# Altium project SISPS-BATT-INT-PCB.PrjPcb (part 2 of 2)

## Sheet EL.SchDoc: Electronic Load
size A4; ApprovedBy: LD Stanton; Author: LD Stanton; CompanyName: University of Cape Town; DrawnBy: Lawrence Stanton; Engineer: Lawrence Stanton; Organization: University of Cape Town; Address1: Department of Electrical Engineering; Address2: Rondebosch; Address3: Cape Town; Address4: South Africa 7701; DocumentNumber: 13; SheetNumber: 13; SheetTotal: 14
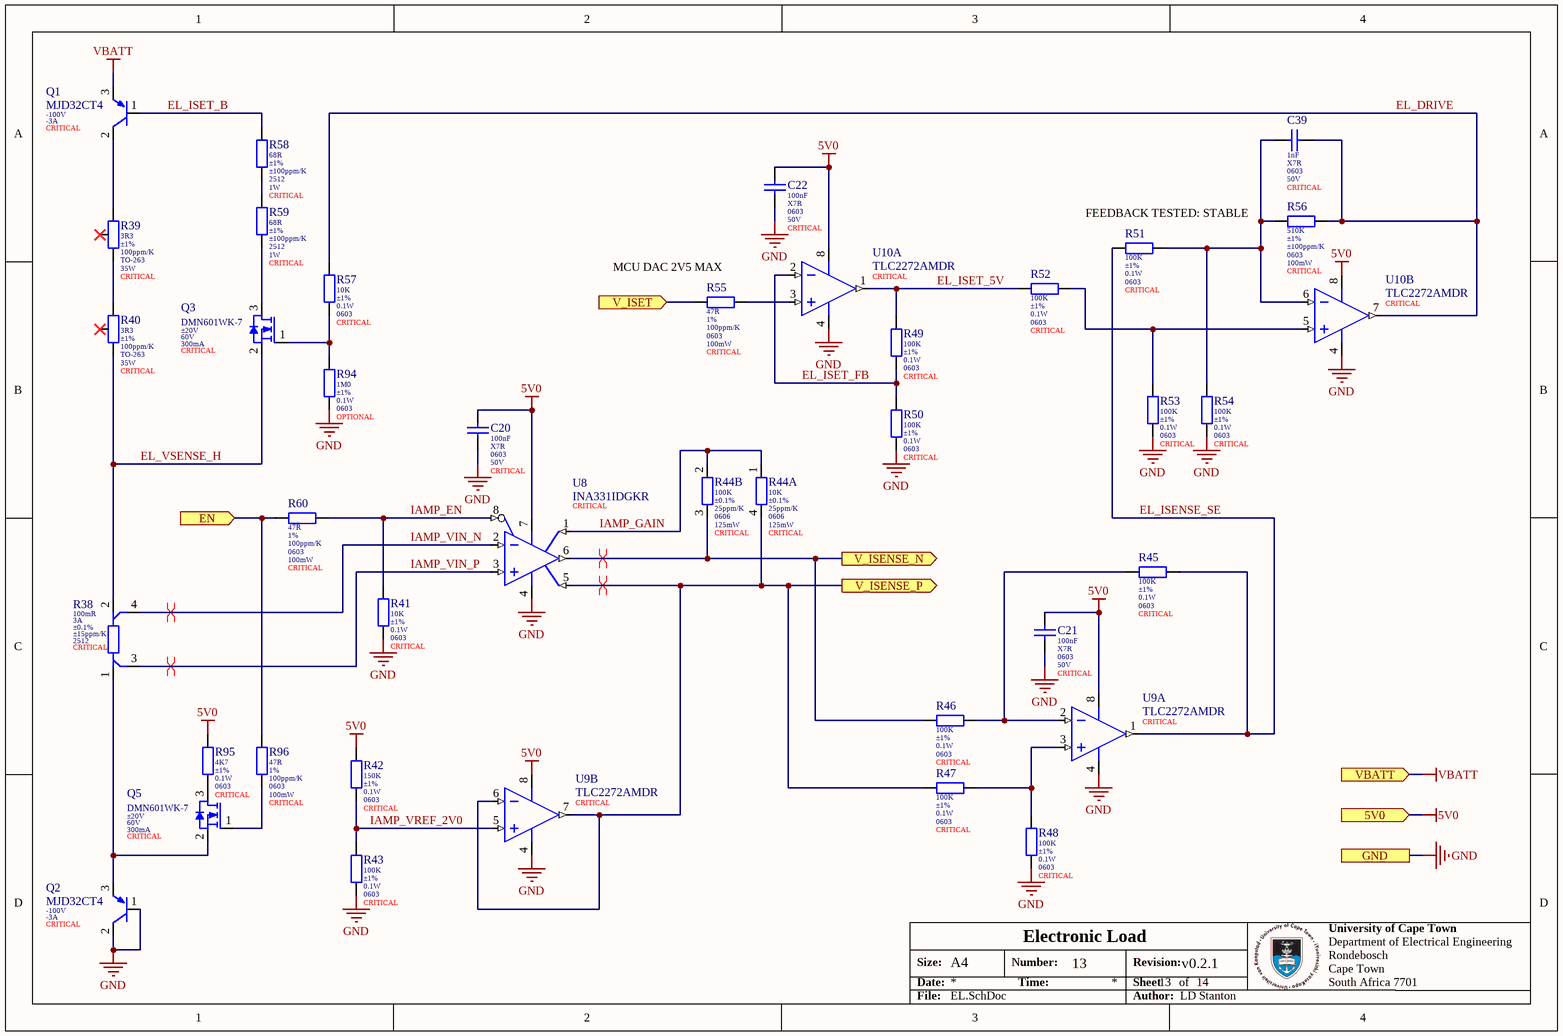
[diagram p8: EL.SchDoc]

### Parts
C20  value 100nF  Dielectric: X7R  Package: 0603  Voltage: 50V  Populate: CRITICAL  [0603 (Yageo DA) B]  (hidden comment: CC0603KRX7R9BB104)
C21  value 100nF  Dielectric: X7R  Package: 0603  Voltage: 50V  Populate: CRITICAL  [0603 (Yageo DA) B]  (hidden comment: CC0603KRX7R9BB104)
C22  value 100nF  Dielectric: X7R  Package: 0603  Voltage: 50V  Populate: CRITICAL  [0603 (Yageo DA) B]  (hidden comment: CC0603KRX7R9BB104)
C39  value 1nF  Dielectric: X7R  Package: 0603  Voltage: 50V  Populate: CRITICAL  [0603_080_8 (Samsung) B]  (hidden comment: CL10B102KB8NNNC)
Q1  MJD32CT4  Collector-Emitter Voltage: -100V  Collector Current: -3A  Placement: CRITICAL  [TO-252 (MJD32C) B]
Q2  MJD32CT4  Collector-Emitter Voltage: -100V  Collector Current: -3A  Placement: CRITICAL  [TO-252 (MJD32C) B]
Q3  DMN601WK-7  Gate Source Voltage: ±20V  Drain Source Voltage: 60V  Continous Drain Current: 300mA  Placement: CRITICAL  [SOT323 (DMN601WK) B]
Q5  DMN601WK-7  Gate Source Voltage: ±20V  Drain Source Voltage: 60V  Continous Drain Current: 300mA  Placement: CRITICAL  [SOT323 (DMN601WK) B]
R38  value 100mR  Current Rating: 3A  Tolerance: ±0.1%  Temperature Coefficient: ±15ppm/K  Package: 2512  Populate: CRITICAL  [2512 (Resi PCSR2512) MRG]  (hidden comment: PCSR2512BR100M6)
R39  value 3R3  Tolerance: ±1%  Temperature Coefficient: 100ppm/K  Package: TO-263  Power: 35W  Populate: CRITICAL  [TO-263 (TPAL0263) B]  (hidden comment: TPAL0263F3R30K9)
R40  value 3R3  Tolerance: ±1%  Temperature Coefficient: 100ppm/K  Package: TO-263  Power: 35W  Populate: CRITICAL  [TO-263 (TPAL0263) B]  (hidden comment: TPAL0263F3R30K9)
R41  value 10K  Tolerance: ±1%  Power: 0.1W  Package: 0603  Populate: CRITICAL  [0603 (Uniroyal) B]  (hidden comment: 0603WAF1002T5E)
R42  value 150K  Tolerance: ±1%  Power: 0.1W  Package: 0603  Populate: CRITICAL  [0603 (Uniroyal) B]  (hidden comment: 0603WAF1503T5E)
R43  value 100K  Tolerance: ±1%  Power: 0.1W  Package: 0603  Populate: CRITICAL  [0603 (Uniroyal) B]  (hidden comment: 0603WAF1003T5E)
R44  value 10K  Tolerance: ±0.1%  Temperature Coefficient: 25ppm/K  Package: 0606  Power: 125mW  Populate: CRITICAL  [0606 (Vishay ACASN) B]  (hidden comment: ACASN1002S1003P1AT)  (parts A,B of 2)
R45  value 100K  Tolerance: ±1%  Power: 0.1W  Package: 0603  Populate: CRITICAL  [0603 (Uniroyal) B]  (hidden comment: 0603WAF1003T5E)
R46  value 100K  Tolerance: ±1%  Power: 0.1W  Package: 0603  Populate: CRITICAL  [0603 (Uniroyal) B]  (hidden comment: 0603WAF1003T5E)
R47  value 100K  Tolerance: ±1%  Power: 0.1W  Package: 0603  Populate: CRITICAL  [0603 (Uniroyal) B]  (hidden comment: 0603WAF1003T5E)
R48  value 100K  Tolerance: ±1%  Power: 0.1W  Package: 0603  Populate: CRITICAL  [0603 (Uniroyal) B]  (hidden comment: 0603WAF1003T5E)
R49  value 100K  Tolerance: ±1%  Power: 0.1W  Package: 0603  Populate: CRITICAL  [0603 (Uniroyal) B]  (hidden comment: 0603WAF1003T5E)
R50  value 100K  Tolerance: ±1%  Power: 0.1W  Package: 0603  Populate: CRITICAL  [0603 (Uniroyal) B]  (hidden comment: 0603WAF1003T5E)
R51  value 100K  Tolerance: ±1%  Power: 0.1W  Package: 0603  Populate: CRITICAL  [0603 (Uniroyal) B]  (hidden comment: 0603WAF1003T5E)
R52  value 100K  Tolerance: ±1%  Power: 0.1W  Package: 0603  Populate: CRITICAL  [0603 (Uniroyal) B]  (hidden comment: 0603WAF1003T5E)
R53  value 100K  Tolerance: ±1%  Power: 0.1W  Package: 0603  Populate: CRITICAL  [0603 (Uniroyal) B]  (hidden comment: 0603WAF1003T5E)
R54  value 100K  Tolerance: ±1%  Power: 0.1W  Package: 0603  Populate: CRITICAL  [0603 (Uniroyal) B]  (hidden comment: 0603WAF1003T5E)
R55  value 47R  Tolerance: 1%  Temperature Coefficient: 100ppm/K  Package: 0603  Power: 100mW  Populate: CRITICAL  [0603 (Uniroyal) B]  (hidden comment: 0603WAF470JT5E)
R56  value 510K  Tolerance: ±1%  Temperature Coefficient: ±100ppm/K  Package: 0603  Power: 100mW  Populate: CRITICAL  [0603 (Uniroyal) B]  (hidden comment: 0603WAF5103T5E)
R57  value 10K  Tolerance: ±1%  Power: 0.1W  Package: 0603  Populate: CRITICAL  [0603 (Uniroyal) B]  (hidden comment: 0603WAF1002T5E)
R58  value 68R  Tolerance: ±1%  Temperature Coefficient: ±100ppm/K  Package: 2512  Power: 1W  Populate: CRITICAL  [2512 (Uniroyal) B]  (hidden comment: 25121WF680JT4E)
R59  value 68R  Tolerance: ±1%  Temperature Coefficient: ±100ppm/K  Package: 2512  Power: 1W  Populate: CRITICAL  [2512 (Uniroyal) B]  (hidden comment: 25121WF680JT4E)
R60  value 47R  Tolerance: 1%  Temperature Coefficient: 100ppm/K  Package: 0603  Power: 100mW  Populate: CRITICAL  [0603 (Uniroyal) B]  (hidden comment: 0603WAF470JT5E)
R94  value 1M0  Tolerance: ±1%  Power: 0.1W  Package: 0603  Populate: OPTIONAL  [0603 (Uniroyal) B]  (hidden comment: 0603WAF1004T5E)
R95  value 4K7  Tolerance: ±1%  Power: 0.1W  Package: 0603  Populate: CRITICAL  [0603 (Uniroyal) B]  (hidden comment: 0603WAF4701T5E)
R96  value 47R  Tolerance: 1%  Temperature Coefficient: 100ppm/K  Package: 0603  Power: 100mW  Populate: CRITICAL  [0603 (Uniroyal) B]  (hidden comment: 0603WAF470JT5E)
U8  INA331IDGKR  Placement: CRITICAL  [MSOP-8 (INA331) B]
U9  TLC2272AMDR  Placement: CRITICAL  [SOIC-8 (D008A) B]  (parts A,B of 2)
U10  TLC2272AMDR  Placement: CRITICAL  [SOIC-8 (D008A) B]  (parts A,B of 2)

### Ports
5V0 (in), EN (in), GND, V_ISENSE_N (out), V_ISENSE_P (out), V_ISET (in), VBATT (in)

### Nets
5V0: C20.1 C21.1 C22.1 R42.1 R95.1 U8.7(V+) U9.8(VDD+) U10.8(VDD+) ; port 5V0  [project net 5V0A]
GND: C20.2 C21.2 C22.2 Q2.1(B) Q2.2(C) R41.2 R43.2 R48.1 R50.1 R53.1 R54.1 R94.2 U8.4(V-) U9.4(VDD-/GND) U10.4(VDD-/GND) ; port GND
VBATT: Q1.3(E) ; port VBATT
EIS_EN: R60.1 R96.2 ; port EN
EIS_VISENSE_N: R44.3 R46.1 U8.6(VOUT) ; port V_ISENSE_N
EIS_VISENSE_P: R44.4 R47.1 U8.5(REF) U9.6(IN2-) U9.7(OUT2) ; port V_ISENSE_P
EL_DRIVE: C39.2 R56.2 R57.1 U10.7(OUT2)
EL_ISENSE_SE: R45.2 R51.2 U9.1(OUT1)
EL_ISET_5V: R49.2 R52.2 U10.1(OUT1)
EL_ISET_B: Q1.1(B) R58.1
EL_ISET_FB: R49.1 R50.2 U10.2(IN1-)
EL_VSENSE_H: Q3.2(S) R38.2 R40.1
IAMP_EN: R41.1 R60.2 U8.8(~{SHUTDOWN})
IAMP_GAIN: R44.1 R44.2 U8.1(RG)
IAMP_VIN_N: R38.4 U8.2(VIN-)
IAMP_VIN_P: R38.3 U8.3(VIN+)
IAMP_VREF_2V0: R42.2 R43.1 U9.5(IN2+)
MCU_DAC: R55.1 ; port V_ISET
NetC39_1: C39.1 R51.1 R54.2 R56.1 U10.6(IN2-)
NetQ1_2: Q1.2(C) R39.2
NetQ2_3: Q2.3(E) Q5.2(S) R38.1
NetQ3_1: Q3.1(G) R57.2 R94.1
NetQ3_3: Q3.3(D) R59.2
NetQ5_1: Q5.1(G) R96.1
NetQ5_3: Q5.3(D) R95.2
NetR39_1: R39.1 R40.2
NetR45_1: R45.1 R46.2 U9.2(IN1-)
NetR47_2: R47.2 R48.2 U9.3(IN1+)
NetR52_1: R52.1 R53.2 U10.5(IN2+)
NetR55_2: R55.2 U10.3(IN1+)
NetR58_2: R58.2 R59.1

Not connected (* = marked no-connect by the designer): R39 3*; R40 3*

### Layout directives
differential pair: EIS_VISENSE_N, EIS_VISENSE_P, IAMP_VIN_N, IAMP_VIN_P

### Notes on the sheet
- (near R51) FEEDBACK TESTED: STABLE
- (near R55) MCU DAC 2V5 MAX
- Labels drawn without touching a wire or pin: \
- Size:
- Date:
- A4
- Number:
- Time:
- Revision:
- Sheet
- of
- File:
- Author:

### Library data of the parts
C20-C22 = CMP-047-000000-9: as C40 on sheet RS485; Tolerance: ±10%; ComponentLink1Description: Datasheet; ComponentLink1URL: https://datasheet.lcsc.com/szlcsc/YAGEO-CC0603KRX7R9BB104_C14663.pdf; LCSC Part Number: C14663
C39 = CMP-045-000000-10: MLCC 1nF 0603 50V X7R ±10%; Manufacturer: Samsung; ComponentLink1URL: https://datasheet.lcsc.com/szlcsc/Samsung-Electro-Mechanics-CL05C100JB5NNNC_C32949.pdf; Tolerance: ±10%; ComponentLink1Description: Datasheet; LCSC Part Number: C1588
Q1 Q2 = CMP-00132-1: Power Bipolar Transistor, 3A I(C), 100V V(BR)CEO, 1-Element, PNP, Silicon, Plastic/Epoxy, 2 Pin; pin to pad: 2>4; Base Current: -1A; Emitter-Base Voltage: -5V; ComponentLink1Description: Datasheet; ComponentLink1URL: https://mm.digikey.com/Volume0/opasdata/d220001/medias/docus/844/MJD32C_Rev4_Jun2012.pdf; Max Operating Temperature: 160°C; LCSC Part Number: C2905365; Min Operating Temperature: -65°C; Collector-Base Voltage: -100V
Q3 Q5 = CMP-00131-1: Mosfet, N-Ch, 60V, 0.3A, Sot-323 Rohs Compliant: Yes; Drain Source Resistance: 2; Polarity: N-Channel; Mode: Enhancement; LCSC Part Number: C151318; ComponentLink1URL: https://jlcpcb.com/api/file/downloadByFileSystemAccessId/8586203582969860096; Min Operating Temperature: -65°C; ComponentLink1Description: Datasheet; Max Operating Temperature: 150°C
R38 = CMP-009-00005-3: 100mΩ 1W Current Sense Resistor ±0.1% ±15ppm/K 2512; LCSC Part Number: C23067426; ComponentLink1URL: https://s.resistor.today/shop/products/epdf/PCSR2512.pdf; Composition: Wirewound; Power: 1W; Min Operating Temperature: -55°C; Max Operating Temperature: 170°C; ComponentLink1Description: Datasheet
R39 R40 = CMP-009-00007-1: 3.3Ω 35W 500V Planar Non-Inductive Power Resistor ±1% ±100ppm/℃ TO-263; ComponentLink1URL: https://s.resistor.today/shop/products/epdf/TPAL0263.pdf; Max Operating Temperature: 150°C; Min Operating Temperature: -55°C; ComponentLink1Description: Datasheet; LCSC Part Number: C22446548; Voltage Rating: 500V
R41 R57 = CMP-010-000293-9: Resistor 10K 0603 ±1% Thick Film Uniroyal; Working Voltage: 75V; Temperature Coefficient: ±100ppm/K; Temperature: -55 - 155°C; ComponentLink1URL: https://datasheet.lcsc.com/szlcsc/1811062009_UNI-ROYAL-Uniroyal-Elec-0603WAF1002T5E_C25804.pdf; LCSC Part Number: C25804; ComponentLink1Description: Datasheet; Pin Count: 2; Manufacturer: Uniroyal
R42 = CMP-010-000303-9: Resistor 150K 0603 ±1% Thick Film Uniroyal; Temperature Coefficient: ±100ppm/K; Working Voltage: 75V; Manufacturer: Uniroyal; ComponentLink1URL: https://datasheet.lcsc.com/szlcsc/1811062009_UNI-ROYAL-Uniroyal-Elec-0603WAF1002T5E_C25804.pdf; Temperature: -55 - 155°C; LCSC Part Number: C22807; ComponentLink1Description: Datasheet; Pin Count: 2
R43 R45-R54 = CMP-010-000288-10: Resistor 100K 0603 ±1% Thick Film Uniroyal; Temperature Coefficient: ±100ppm/K; Working Voltage: 75V; LCSC Part Number: C25803; Temperature: -55 - 155°C; ComponentLink1URL: https://datasheet.lcsc.com/szlcsc/1811062009_UNI-ROYAL-Uniroyal-Elec-0603WAF1002T5E_C25804.pdf; Pin Count: 2; Manufacturer: Uniroyal; ComponentLink1Description: Datasheet
R44 = CMP-009-00004-9: Resistor Array 100K,10K 0606 ±0.1% Thin Film Vishay; Voltage Rating: 100V; Min Operating Temperature: -55°C; LCSC Part Number: C6733329; Composition: Thin Film; ComponentLink1URL: https://www.vishay.com/docs/28770/acasat.pdf; Value 1: 10K; Value 2: 100K; ComponentLink1Description: Datasheet; Max Operating Temperature: 125°C
R55 R60 R96 = CMP-00128-3: as R76 on sheet RS485; ComponentLink1Description: Datasheet; Min Operating Temperature: -55°C; Manufacturer: Uniroyal; ComponentLink1URL: https://datasheet.lcsc.com/szlcsc/1811062009_UNI-ROYAL-Uniroyal-Elec-0603WAF1002T5E_C25804.pdf; Composition: Thick Film; LCSC Part Number: C23182; Max Operating Temperature: 155°C
R56 = CMP-00137-1: Resistor 510K 0603 ±1% Thick Film Uniroyal; Voltage Rating: 75V; Min Operating Temperature: -55°C; ComponentLink1Description: Datasheet; Manufacturer: Uniroyal; LCSC Part Number: C23192; ComponentLink1URL: https://datasheet.lcsc.com/szlcsc/1811062009_UNI-ROYAL-Uniroyal-Elec-0603WAF1002T5E_C25804.pdf; Max Operating Temperature: 155°C; Composition: Thick Film
R58 R59 = CMP-00133-1: Resistor 68R 2512 ±1% 1W Thick Film Uniroyal; Voltage Rating: 200V; ComponentLink1URL: https://datasheet.lcsc.com/lcsc/1810301111_UNI-ROYAL-Uniroyal-Elec-25121WF100MT4E_C127692.pdf; ComponentLink1Description: Datasheet; Max Operating Temperature: 155°C; Temperature: -55 - 155°C; Min Operating Temperature: -55°C; Composition: Thick Film; LCSC Part Number: C50371
R94 = CMP-010-000313-12: Resistor 1M0 0603 ±1% Thick Film Uniroyal; Working Voltage: 75V; Temperature Coefficient: ±100ppm/K; Temperature: -55 - 155°C; Pin Count: 2; Manufacturer: Uniroyal; LCSC Part Number: C22935; ComponentLink1Description: Datasheet; ComponentLink1URL: https://datasheet.lcsc.com/szlcsc/1811062009_UNI-ROYAL-Uniroyal-Elec-0603WAF1002T5E_C25804.pdf
R95 = CMP-010-000405-2: Resistor 4K7 0603 ±1% Thick Film Uniroyal; Temperature Coefficient: ±100ppm/K; Working Voltage: 75V; Manufacturer: Uniroyal; ComponentLink1Description: Datasheet; Temperature: -55 - 155°C; ComponentLink1URL: https://datasheet.lcsc.com/szlcsc/1811062009_UNI-ROYAL-Uniroyal-Elec-0603WAF1002T5E_C25804.pdf; LCSC Part Number: C23162
U8 = CMP-014-00000-1: Low-Power, Single Supply, CMOS, Instrumentation Amplifier 8-VSSOP -55 to 125; Output Current: 48mA; Output Type: Push-Pull; Max Supply Voltage: 5.5V; Min Supply Voltage: 2.5V; Min Operating Temperature: -55°C; Max Operating Temperature: 125°C; ComponentLink1Description: Datasheet; ComponentLink1URL: https://www.ti.com/lit/ds/symlink/ina331.pdf?ts=1756763479272&ref_url=https%253A%252F%252Fwww.google.com%252F; LCSC Part Number: C2863664
U9 U10 = CMP-00126-1: Operational Amplifier, 2 Func, 1500uV Offset-Max, CMOS, PDSO8; Single Supply: Yes; Output Current: 50mA; Input Bias Current: 800pA; Input Offset Voltage: 1.5mV; Supply Max: 8V; Supply Min: -8V; Rail to Rail: Yes; ComponentLink1Description: Datasheet; Input Offset Current: 800pA; LCSC Part Number: C2878284; Min Operating Temperature: -55°C; Max Operating Temperature: 125°C; ComponentLink1URL: https://www.ti.com/lit/ds/symlink/tlc2272.pdf?ts=1754033641708&ref_url=https%253A%252F%252Fwww.ti.com%252Fproduct%252FTLC2272%253Futm_source%253Dgoogle%2526utm_medium%253Dcpc%2526utm_campaign%253Dasc-amps-null-44700045336317476_prodfolderdynamic-cpc-pf-go

## Sheet VBATT Sense.SchDoc: Battery Voltage Sense
size A4; ApprovedBy: LD Stanton; Author: LD Stanton; CompanyName: University of Cape Town; DrawnBy: Lawrence Stanton; Engineer: Lawrence Stanton; Organization: University of Cape Town; Address1: Department of Electrical Engineering; Address2: Rondebosch; Address3: Cape Town; Address4: South Africa 7701; DocumentNumber: 11; SheetNumber: 11; SheetTotal: 14
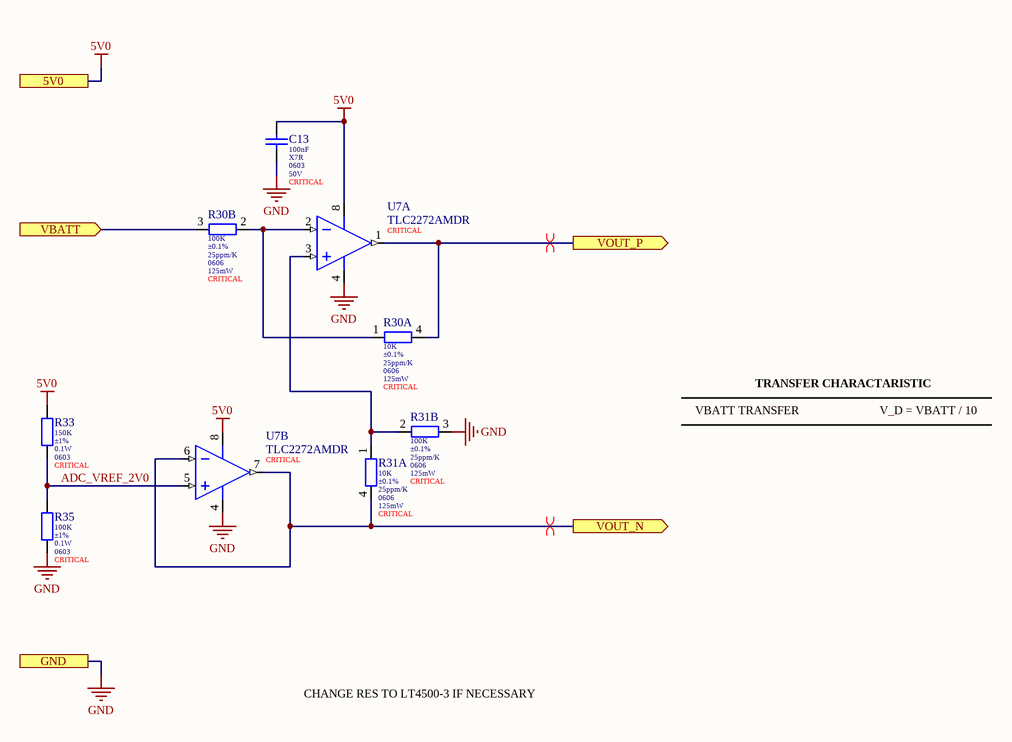
[diagram p9: VBATT Sense.SchDoc]

### Parts
C13  value 100nF  Dielectric: X7R  Package: 0603  Voltage: 50V  Populate: CRITICAL  [0603 (Yageo DA) B]  (hidden comment: CC0603KRX7R9BB104)
R30  value 10K  Tolerance: ±0.1%  Temperature Coefficient: 25ppm/K  Package: 0606  Power: 125mW  Populate: CRITICAL  [0606 (Vishay ACASN) B]  (hidden comment: ACASN1002S1003P1AT)  (parts A,B of 2)
R31  value 10K  Tolerance: ±0.1%  Temperature Coefficient: 25ppm/K  Package: 0606  Power: 125mW  Populate: CRITICAL  [0606 (Vishay ACASN) B]  (hidden comment: ACASN1002S1003P1AT)  (parts A,B of 2)
R33  value 150K  Tolerance: ±1%  Power: 0.1W  Package: 0603  Populate: CRITICAL  [0603 (Uniroyal) B]  (hidden comment: 0603WAF1503T5E)
R35  value 100K  Tolerance: ±1%  Power: 0.1W  Package: 0603  Populate: CRITICAL  [0603 (Uniroyal) B]  (hidden comment: 0603WAF1003T5E)
U7  TLC2272AMDR  Placement: CRITICAL  [SOIC-8 (D008A) B]  (parts A,B of 2)

### Ports
5V0, GND, VBATT (in), VOUT_N (out), VOUT_P (out)

### Nets
5V0: C13.1 R33.1 U7.8(VDD+) ; port 5V0  [project net 5V0A]
GND: C13.2 R31.3 R35.2 U7.4(VDD-/GND) ; port GND
VBATT: R30.3 ; port VBATT
ADC_VREF_2V0: R33.2 R35.1 U7.5(IN2+)
EIS_VBATT_N: R31.4 U7.6(IN2-) U7.7(OUT2) ; port VOUT_N
EIS_VBATT_P: R30.4 U7.1(OUT1) ; port VOUT_P
NetR30_1: R30.1 R30.2 U7.2(IN1-)
NetR31_1: R31.1 R31.2 U7.3(IN1+)

### Layout directives
differential pair: EIS_VBATT_N, EIS_VBATT_P

### Notes on the sheet
- VBATT TRANSFER
- TRANSFER CHARACTARISTIC
- V_D = VBATT / 10
- CHANGE RES TO LT4500-3 IF NECESSARY
- Size:
- Date:
- A4
- Number:
- Time:
- Revision:
- Sheet
- of
- File:
- Author:

### Library data of the parts
C13 = CMP-047-000000-9: as C40 on sheet RS485; Tolerance: ±10%; ComponentLink1Description: Datasheet; ComponentLink1URL: https://datasheet.lcsc.com/szlcsc/YAGEO-CC0603KRX7R9BB104_C14663.pdf; LCSC Part Number: C14663
R30 R31 = CMP-009-00004-9: as R44 on sheet EL; LCSC Part Number: C6733329; Value 2: 100K; Composition: Thin Film; Value 1: 10K; Min Operating Temperature: -55°C; Max Operating Temperature: 125°C; ComponentLink1URL: https://www.vishay.com/docs/28770/acasat.pdf; ComponentLink1Description: Datasheet
R33 = CMP-010-000303-9: as R42 on sheet EL; Manufacturer: Uniroyal; ComponentLink1URL: https://datasheet.lcsc.com/szlcsc/1811062009_UNI-ROYAL-Uniroyal-Elec-0603WAF1002T5E_C25804.pdf; Temperature: -55 - 155°C; LCSC Part Number: C22807; ComponentLink1Description: Datasheet; Pin Count: 2
R35 = CMP-010-000288-10: as R43 on sheet EL; LCSC Part Number: C25803; Temperature: -55 - 155°C; ComponentLink1URL: https://datasheet.lcsc.com/szlcsc/1811062009_UNI-ROYAL-Uniroyal-Elec-0603WAF1002T5E_C25804.pdf; Pin Count: 2; Manufacturer: Uniroyal; ComponentLink1Description: Datasheet
U7 = CMP-00126-1: as U9 on sheet EL; Rail to Rail: Yes; ComponentLink1Description: Datasheet; Input Offset Current: 800pA; LCSC Part Number: C2878284; Min Operating Temperature: -55°C; Max Operating Temperature: 125°C; ComponentLink1URL: https://www.ti.com/lit/ds/symlink/tlc2272.pdf?ts=1754033641708&ref_url=https%253A%252F%252Fwww.ti.com%252Fproduct%252FTLC2272%253Futm_source%253Dgoogle%2526utm_medium%253Dcpc%2526utm_campaign%253Dasc-amps-null-44700045336317476_prodfolderdynamic-cpc-pf-go

## Sheet ADC.SchDoc: Analogue to Digital Converter
size A4; ApprovedBy: LD Stanton; Author: LD Stanton; CompanyName: University of Cape Town; DrawnBy: Lawrence Stanton; Engineer: Lawrence Stanton; Organization: University of Cape Town; Address1: Department of Electrical Engineering; Address2: Rondebosch; Address3: Cape Town; Address4: South Africa 7701; DocumentNumber: 8; SheetNumber: 8; SheetTotal: 14
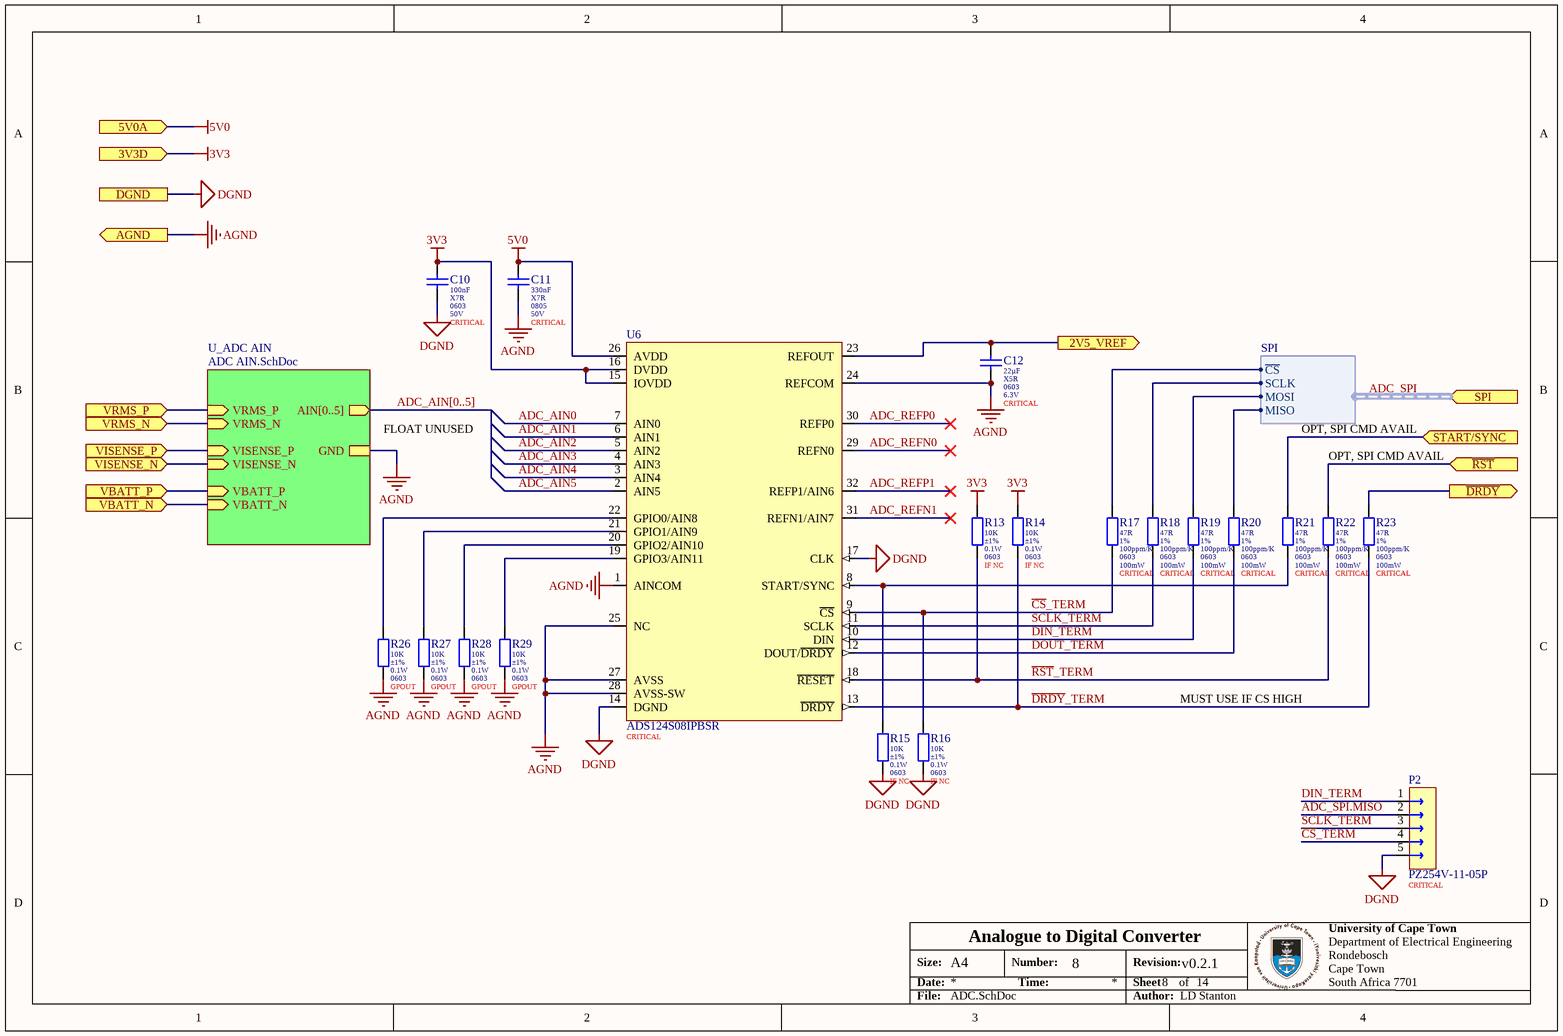
[diagram p10: ADC.SchDoc]

### Parts
C10  value 100nF  Dielectric: X7R  Package: 0603  Voltage: 50V  Populate: CRITICAL  [0603 (Yageo DA) B]  (hidden comment: CC0603KRX7R9BB104)
C11  value 330nF  Dielectric: X7R  Package: 0805  Voltage: 50V  Populate: CRITICAL  [0805_125_F (Samsumg) B]  (hidden comment: CL21B334KBFNNNE)
C12  value 22µF  Dielectric: X5R  Package: 0603  Voltage: 6.3V  Populate: CRITICAL  [0603_080_8 (Samsung) B]  (hidden comment: CL10A226MQ8NRNC)
P2  PZ254V-11-05P  Placement: CRITICAL  [Pin Header 5 1 Male Vertical]
R13  value 10K  Tolerance: ±1%  Power: 0.1W  Package: 0603  Populate: IF NC  [0603 (Uniroyal) B]  (hidden comment: 0603WAF1002T5E)
R14  value 10K  Tolerance: ±1%  Power: 0.1W  Package: 0603  Populate: IF NC  [0603 (Uniroyal) B]  (hidden comment: 0603WAF1002T5E)
R15  value 10K  Tolerance: ±1%  Power: 0.1W  Package: 0603  Populate: IF NC  [0603 (Uniroyal) B]  (hidden comment: 0603WAF1002T5E)
R16  value 10K  Tolerance: ±1%  Power: 0.1W  Package: 0603  Populate: IF NC  [0603 (Uniroyal) B]  (hidden comment: 0603WAF1002T5E)
R17  value 47R  Tolerance: 1%  Temperature Coefficient: 100ppm/K  Package: 0603  Power: 100mW  Populate: CRITICAL  [0603 (Uniroyal) B]  (hidden comment: 0603WAF470JT5E)
R18  value 47R  Tolerance: 1%  Temperature Coefficient: 100ppm/K  Package: 0603  Power: 100mW  Populate: CRITICAL  [0603 (Uniroyal) B]  (hidden comment: 0603WAF470JT5E)
R19  value 47R  Tolerance: 1%  Temperature Coefficient: 100ppm/K  Package: 0603  Power: 100mW  Populate: CRITICAL  [0603 (Uniroyal) B]  (hidden comment: 0603WAF470JT5E)
R20  value 47R  Tolerance: 1%  Temperature Coefficient: 100ppm/K  Package: 0603  Power: 100mW  Populate: CRITICAL  [0603 (Uniroyal) B]  (hidden comment: 0603WAF470JT5E)
R21  value 47R  Tolerance: 1%  Temperature Coefficient: 100ppm/K  Package: 0603  Power: 100mW  Populate: CRITICAL  [0603 (Uniroyal) B]  (hidden comment: 0603WAF470JT5E)
R22  value 47R  Tolerance: 1%  Temperature Coefficient: 100ppm/K  Package: 0603  Power: 100mW  Populate: CRITICAL  [0603 (Uniroyal) B]  (hidden comment: 0603WAF470JT5E)
R23  value 47R  Tolerance: 1%  Temperature Coefficient: 100ppm/K  Package: 0603  Power: 100mW  Populate: CRITICAL  [0603 (Uniroyal) B]  (hidden comment: 0603WAF470JT5E)
R26  value 10K  Tolerance: ±1%  Power: 0.1W  Package: 0603  Populate: GPOUT  [0603 (Uniroyal) B]  (hidden comment: 0603WAF1002T5E)
R27  value 10K  Tolerance: ±1%  Power: 0.1W  Package: 0603  Populate: GPOUT  [0603 (Uniroyal) B]  (hidden comment: 0603WAF1002T5E)
R28  value 10K  Tolerance: ±1%  Power: 0.1W  Package: 0603  Populate: GPOUT  [0603 (Uniroyal) B]  (hidden comment: 0603WAF1002T5E)
R29  value 10K  Tolerance: ±1%  Power: 0.1W  Package: 0603  Populate: GPOUT  [0603 (Uniroyal) B]  (hidden comment: 0603WAF1002T5E)
U6  ADS124S08IPBSR  Placement: CRITICAL  [QFP-32 (ADS124) A]

### Sub-sheets
U_ADC AIN = ADC AIN.SchDoc: AIN[0..5] (out), VRMS_P (in), VRMS_N (in), GND, VISENSE_P (in), VISENSE_N (in), VBATT_P (in), VBATT_N (in)

### Ports
2V5_VREF (out), 3V3D (in), 5V0A (in), AGND (out), DGND, SPI (in, harness SPI), START/SYNC (in), VBATT_N (in), VBATT_P (in), VISENSE_N (in), VISENSE_P (in), VRMS_N (in), VRMS_P (in), ~{DRDY} (out), ~{RST} (in)

### Harnesses
SPI: ~{CS}, SCLK, MOSI, MISO

### Nets
3V3: C10.1 R13.1 R14.1 U6.15(IOVDD) U6.16(DVDD) ; port 3V3D
5V0: C11.1 U6.26(AVDD) ; port 5V0A  [project net 5V0A]
AGND: C10.2 C11.2 C12.2 P2.5 R15.2 R16.2 R26.2 R27.2 R28.2 R29.2 U6.1(AINCOM) U6.14(DGND) U6.17(CLK) U6.24(REFCOM) U6.25(NC) U6.27(AVSS) U6.28(AVSS-SW) ; port DGND, port AGND, sheet U_ADC AIN/GND  [also labelled DGND]  [project net GND]
ADC_AIN0: U6.7(AIN0)
ADC_AIN1: U6.6(AIN1)
ADC_AIN2: U6.5(AIN2)
ADC_AIN3: U6.4(AIN3)
ADC_AIN4: U6.3(AIN4)
ADC_AIN5: U6.2(AIN5)
ADC_~{DRDY}: R23.1 ; port ~{DRDY}
ADC_~{RST}: R22.1 ; port ~{RST}
ADC_REFN0: U6.29(REFN0)
ADC_REFN1: U6.31(REFN1/AIN7)
ADC_REFP0: U6.30(REFP0)
ADC_REFP1: U6.32(REFP1/AIN6)
ADC_SPI~{.}CS: R17.1 ; port SPI.~{CS}
ADC_SPI.MISO: R20.1 ; port SPI.MISO
ADC_SPI.MISO: P2.2  [a separate net that carries the same name]
ADC_SPI.MOSI: R19.1 ; port SPI.MOSI
ADC_SPI.SCLK: R18.1 ; port SPI.SCLK
ADC_START: R21.1 ; port START/SYNC
ADC_VREF: C12.1 U6.23(REFOUT) ; port 2V5_VREF
~{CS}_TERM: P2.4 R16.1 R17.2 U6.9(~{CS})
~{DRDY}_TERM: R14.2 R23.2 U6.13(~{DRDY})
DIN_TERM: P2.1 R19.2 U6.10(DIN)
DOUT_TERM: R20.2 U6.12(DOUT/~{DRDY})
EIS_VBATT_N: port VBATT_N, sheet U_ADC AIN/VBATT_N
EIS_VBATT_P: port VBATT_P, sheet U_ADC AIN/VBATT_P
EIS_VISENSE_N: port VISENSE_N, sheet U_ADC AIN/VISENSE_N
EIS_VISENSE_P: port VISENSE_P, sheet U_ADC AIN/VISENSE_P
EIS_VRMS_N: port VRMS_N, sheet U_ADC AIN/VRMS_N
EIS_VRMS_P: port VRMS_P, sheet U_ADC AIN/VRMS_P
~{RST}_TERM: R13.2 R22.2 U6.18(~{RESET})
SCLK_TERM: P2.3 R18.2 U6.11(SCLK)
NetR15_1: R15.1 R21.2 U6.8(START/SYNC)
NetR26_1: R26.1 U6.22(GPIO0/AIN8)
NetR27_1: R27.1 U6.21(GPIO1/AIN9)
NetR28_1: R28.1 U6.20(GPIO2/AIN10)
NetR29_1: R29.1 U6.19(GPIO3/AIN11)

### Buses and harness runs
bus ADC_AIN[0..5] = sheet U_ADC AIN/AIN[0..5]
harness ADC_SPI = port SPI

### Notes on the sheet
- FLOAT UNUSED
- OPT, SPI CMD AVAIL
- MUST USE IF CS HIGH
- Size:
- Date:
- A4
- Number:
- Time:
- Revision:
- Sheet
- of
- File:
- Author:

### Library data of the parts
C10 = CMP-047-000000-9: as C40 on sheet RS485; Tolerance: ±10%; ComponentLink1Description: Datasheet; ComponentLink1URL: https://datasheet.lcsc.com/szlcsc/YAGEO-CC0603KRX7R9BB104_C14663.pdf; LCSC Part Number: C14663
C11 = CMP-001-00002-2: MLCC 330nF 0805 50V X7R ±10%; Manufacturer: Samsung; LCSC Part Number: C73142; ComponentLink1URL: https://datasheet.lcsc.com/szlcsc/Samsung-Electro-Mechanics-CL05C100JB5NNNC_C32949.pdf; ComponentLink1Description: Datasheet; Max Operating Temperature: 125°C; Min Operating Temperature: -55°C; Tolerance: 10%
C12 = CMP-00130-1: MLCC 22uF 0603 6V3 X5R ±20%; Manufacturer: Samsung; Tolerance: 20%; ComponentLink1Description: Datasheet; ComponentLink1URL: https://datasheet.lcsc.com/szlcsc/Samsung-Electro-Mechanics-CL05C100JB5NNNC_C32949.pdf; Max Operating Temperature: 85°C; LCSC Part Number: C59461; Min Operating Temperature: -55°C
P2 = CMP-00148-2: Pin Header 5 1 Vertical Male; ComponentLink1URL: https://datasheet.lcsc.com/lcsc/2003191006_XFCN-PZ254V-11-06P_C492405.pdf; LCSC Part Number: C492404; ComponentLink1Description: Datasheet
R13-R16 R26-R29 = CMP-010-000293-9: as R41 on sheet EL; Temperature: -55 - 155°C; ComponentLink1URL: https://datasheet.lcsc.com/szlcsc/1811062009_UNI-ROYAL-Uniroyal-Elec-0603WAF1002T5E_C25804.pdf; LCSC Part Number: C25804; ComponentLink1Description: Datasheet; Pin Count: 2; Manufacturer: Uniroyal
R17-R23 = CMP-00128-3: as R76 on sheet RS485; ComponentLink1Description: Datasheet; Min Operating Temperature: -55°C; Manufacturer: Uniroyal; ComponentLink1URL: https://datasheet.lcsc.com/szlcsc/1811062009_UNI-ROYAL-Uniroyal-Elec-0603WAF1002T5E_C25804.pdf; Composition: Thick Film; LCSC Part Number: C23182; Max Operating Temperature: 155°C
U6 = CMP-00127-3: ADC, Delta-Sigma, 24-Bit, 1 Func, 12 Channel, Serial Access, PQFP32; Sampling Rate: 4ksps; Resolution: 24; Min Operating Temperature: -50°C; Max Operating Temperature: 125°C; LCSC Part Number: C2870171; ComponentLink2Description: Product Page; ComponentLink2URL: https://www.ti.com/product/ADS124S08/part-details/ADS124S08IPBSR; ComponentLink1Description: Datasheet; ComponentLink1URL: https://www.ti.com/lit/ds/symlink/ads124s08.pdf

## Sheet ADC AIN.SchDoc: ADC Analogue Input Connections
size A4; ApprovedBy: LD Stanton; Author: LD Stanton; CompanyName: University of Cape Town; DrawnBy: Lawrence Stanton; Engineer: Lawrence Stanton; Organization: University of Cape Town; Address1: Department of Electrical Engineering; Address2: Rondebosch; Address3: Cape Town; Address4: South Africa 7701; DocumentNumber: 9; SheetNumber: 9; SheetTotal: 14
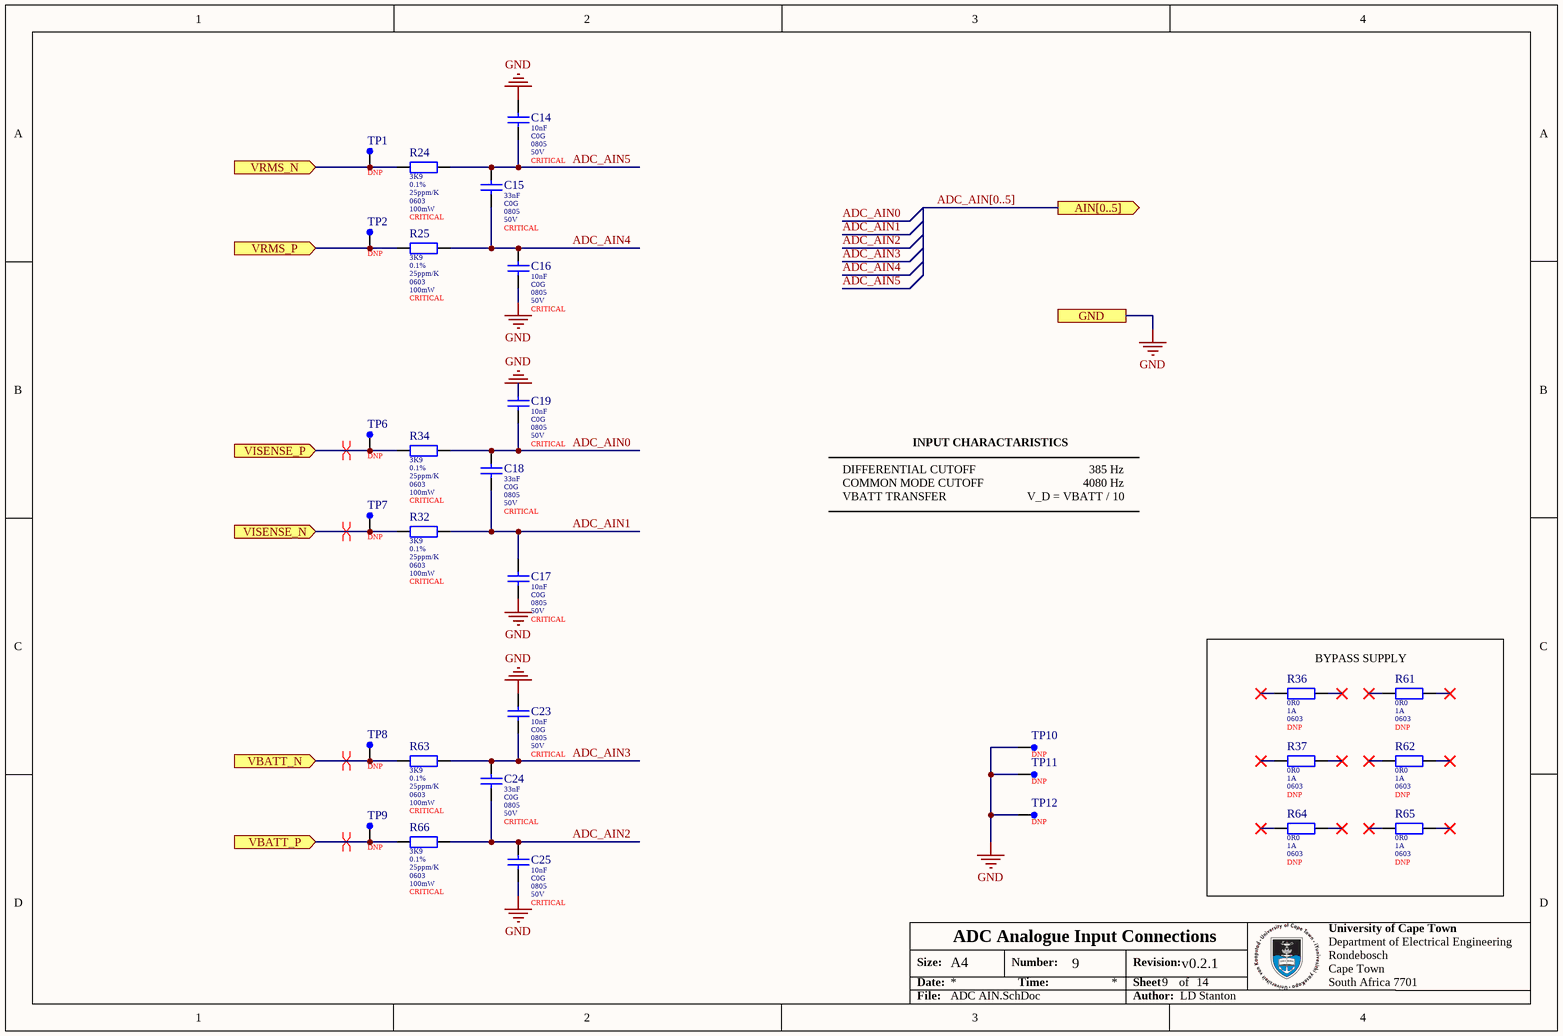
[diagram p11: ADC AIN.SchDoc]

### Parts
C14  value 10nF  Dielectric: C0G  Package: 0805  Voltage: 50V  Populate: CRITICAL  [0805 (Murata GRM) B]  (hidden comment: GRM2195C1H103FA01D)
C15  value 33nF  Dielectric: C0G  Package: 0805  Voltage: 50V  Populate: CRITICAL  [0805 (Murata GRM) B]  (hidden comment: GRM2165C1H333JA01D)
C16  value 10nF  Dielectric: C0G  Package: 0805  Voltage: 50V  Populate: CRITICAL  [0805 (Murata GRM) B]  (hidden comment: GRM2195C1H103FA01D)
C17  value 10nF  Dielectric: C0G  Package: 0805  Voltage: 50V  Populate: CRITICAL  [0805 (Murata GRM) B]  (hidden comment: GRM2195C1H103FA01D)
C18  value 33nF  Dielectric: C0G  Package: 0805  Voltage: 50V  Populate: CRITICAL  [0805 (Murata GRM) B]  (hidden comment: GRM2165C1H333JA01D)
C19  value 10nF  Dielectric: C0G  Package: 0805  Voltage: 50V  Populate: CRITICAL  [0805 (Murata GRM) B]  (hidden comment: GRM2195C1H103FA01D)
C23  value 10nF  Dielectric: C0G  Package: 0805  Voltage: 50V  Populate: CRITICAL  [0805 (Murata GRM) B]  (hidden comment: GRM2195C1H103FA01D)
C24  value 33nF  Dielectric: C0G  Package: 0805  Voltage: 50V  Populate: CRITICAL  [0805 (Murata GRM) B]  (hidden comment: GRM2165C1H333JA01D)
C25  value 10nF  Dielectric: C0G  Package: 0805  Voltage: 50V  Populate: CRITICAL  [0805 (Murata GRM) B]  (hidden comment: GRM2195C1H103FA01D)
R24  value 3K9  Tolerance: 0.1%  Temperature Coefficient: 25ppm/K  Package: 0603  Power: 100mW  Populate: CRITICAL  [0603 (Yageo RT) B]  (hidden comment: RT0603BRD073K9L)
R25  value 3K9  Tolerance: 0.1%  Temperature Coefficient: 25ppm/K  Package: 0603  Power: 100mW  Populate: CRITICAL  [0603 (Yageo RT) B]  (hidden comment: RT0603BRD073K9L)
R32  value 3K9  Tolerance: 0.1%  Temperature Coefficient: 25ppm/K  Package: 0603  Power: 100mW  Populate: CRITICAL  [0603 (Yageo RT) B]  (hidden comment: RT0603BRD073K9L)
R34  value 3K9  Tolerance: 0.1%  Temperature Coefficient: 25ppm/K  Package: 0603  Power: 100mW  Populate: CRITICAL  [0603 (Yageo RT) B]  (hidden comment: RT0603BRD073K9L)
R36  value 0R0  Current: 1A  Package: 0603  Populate: DNP  [0603 (Uniroyal) B]  (hidden comment: 0603WAF0000T5E)
R37  value 0R0  Current: 1A  Package: 0603  Populate: DNP  [0603 (Uniroyal) B]  (hidden comment: 0603WAF0000T5E)
R61  value 0R0  Current: 1A  Package: 0603  Populate: DNP  [0603 (Uniroyal) B]  (hidden comment: 0603WAF0000T5E)
R62  value 0R0  Current: 1A  Package: 0603  Populate: DNP  [0603 (Uniroyal) B]  (hidden comment: 0603WAF0000T5E)
R63  value 3K9  Tolerance: 0.1%  Temperature Coefficient: 25ppm/K  Package: 0603  Power: 100mW  Populate: CRITICAL  [0603 (Yageo RT) B]  (hidden comment: RT0603BRD073K9L)
R64  value 0R0  Current: 1A  Package: 0603  Populate: DNP  [0603 (Uniroyal) B]  (hidden comment: 0603WAF0000T5E)
R65  value 0R0  Current: 1A  Package: 0603  Populate: DNP  [0603 (Uniroyal) B]  (hidden comment: 0603WAF0000T5E)
R66  value 3K9  Tolerance: 0.1%  Temperature Coefficient: 25ppm/K  Package: 0603  Power: 100mW  Populate: CRITICAL  [0603 (Yageo RT) B]  (hidden comment: RT0603BRD073K9L)
TP1  Placement: DNP  [Test Point Keystone 5000]  (hidden comment: 5000)
TP2  Placement: DNP  [Test Point Keystone 5000]  (hidden comment: 5000)
TP6  Placement: DNP  [Test Point Keystone 5000]  (hidden comment: 5000)
TP7  Placement: DNP  [Test Point Keystone 5000]  (hidden comment: 5000)
TP8  Placement: DNP  [Test Point Keystone 5000]  (hidden comment: 5000)
TP9  Placement: DNP  [Test Point Keystone 5000]  (hidden comment: 5000)
TP10  Placement: DNP  [Test Point Keystone 5001]  (hidden comment: 5001)
TP11  Placement: DNP  [Test Point Keystone 5001]  (hidden comment: 5001)
TP12  Placement: DNP  [Test Point Keystone 5001]  (hidden comment: 5001)

### Blocks framed on the sheet
BYPASS SUPPLY: R36 R37 R61 R62 R64 R65

### Ports
AIN[0..5] (out), GND, VBATT_N (in), VBATT_P (in), VISENSE_N (in), VISENSE_P (in), VRMS_N (in), VRMS_P (in)

### Nets
GND: C14.2 C16.1 C17.2 C19.1 C23.2 C25.1 TP10.1 TP11.1 TP12.1 ; port GND
ADC_AIN0: C18.2 C19.2 R34.2
ADC_AIN1: C17.1 C18.1 R32.2
ADC_AIN2: C24.2 C25.2 R66.2
ADC_AIN3: C23.1 C24.1 R63.2
ADC_AIN4: C15.2 C16.2 R25.2
ADC_AIN5: C14.1 C15.1 R24.2
EIS_VBATT_N: R63.1 TP8.1 ; port VBATT_N
EIS_VBATT_P: R66.1 TP9.1 ; port VBATT_P
EIS_VISENSE_N: R32.1 TP7.1 ; port VISENSE_N
EIS_VISENSE_P: R34.1 TP6.1 ; port VISENSE_P
EIS_VRMS_N: R24.1 TP1.1 ; port VRMS_N
EIS_VRMS_P: R25.1 TP2.1 ; port VRMS_P

Not connected (* = marked no-connect by the designer): R36 1* 2*; R37 1* 2*; R61 1* 2*; R62 1* 2*; R64 1* 2*; R65 1* 2*

### Buses and harness runs
bus ADC_AIN[0..5] = port AIN[0..5]

### Layout directives
differential pair: EIS_VBATT_N, EIS_VBATT_P, EIS_VISENSE_N, EIS_VISENSE_P

### Notes on the sheet
- INPUT CHARACTARISTICS
- DIFFERENTIAL CUTOFF
- COMMON MODE CUTOFF
- VBATT TRANSFER
- 385 Hz
- 4080 Hz
- V_D = VBATT / 10
- Size:
- Date:
- A4
- Number:
- Time:
- Revision:
- Sheet
- of
- File:
- Author:

### Library data of the parts
C14 C16 C17 C19 C23 C25 = CMP-00129-1: MLCC 10nF 0805 50V C0G ±1%; Manufacturer: Murata; Tolerance: 1%; ComponentLink1Description: Catalogue; ComponentLink2Description: Product Page; ComponentLink2URL: https://www.murata.com/en-global/products/productdetail.aspx?partno=GRM2195C1H103JA01%23; ComponentLink3URL: https://search.murata.co.jp/Ceramy/image/img/A01X/G101/ENG/GRM2195C1H103JA01-01A.pdf; ComponentLink1URL: https://jlcpcb.com/api/file/downloadByFileSystemAccessId/8588936099087454208; ComponentLink3Description: Datasheet; LCSC Part Number: C441760; Max Operating Temperature: 125°C; Min Operating Temperature: -55°C
C15 C18 C24 = CMP-001-00005-1: MLCC 33nF 0805 50V C0G ±5%; Manufacturer: Murata; Max Operating Temperature: 125°C; ComponentLink3Description: Datasheet; LCSC Part Number: C1518212; ComponentLink2URL: https://www.murata.com/products/productdetail?partno=GRM2165C1H333JA01%23; Min Operating Temperature: -55°C; Tolerance: 5%; ComponentLink3URL: https://search.murata.co.jp/Ceramy/image/img/A01X/G101/ENG/GRM2165C1H333JA01-01A.pdf; ComponentLink1URL: https://jlcpcb.com/api/file/downloadByFileSystemAccessId/8588936099087454208; ComponentLink2Description: Product Page; ComponentLink1Description: Catalogue
R24 R25 R32 R34 R63 R66 = CMP-009-00003-1: Resistor 3K9 0603 ±0.1% Thin Film Yaego; Voltage Rating: 75V; Composition: Thin Film; Min Operating Temperature: -55°C; LCSC Part Number: C728592; ComponentLink1URL: https://jlcpcb.com/api/file/downloadByFileSystemAccessId/8588919467732840449; Max Operating Temperature: 155°C; Manufacturer: Yaego; ComponentLink1Description: Datasheet
R36 R37 R61 R62 R64 R65 = CMP-010-000359-7: Jumper 0603 1A Uniroyal; Pin Count: 2; ComponentLink1URL: https://datasheet.lcsc.com/szlcsc/1811062009_UNI-ROYAL-Uniroyal-Elec-0603WAF1002T5E_C25804.pdf; Manufacturer: Uniroyal; LCSC Part Number: C21189; Temperature: -55 - 155°C; ComponentLink1Description: Datasheet
TP1 TP2 TP6-TP9 = CMP-00140-2: Keystone Test Point Insulated Ring Red; LCSC Part Number: C5199900
TP10-TP12 = CMP-00028-00009-2: Keystone Test Point Insulated Ring Black; LCSC Part Number: C238122

## Sheet LINREG.SchDoc: Linear Voltage Regulators
size A4; ApprovedBy: LD Stanton; Author: LD Stanton; CompanyName: University of Cape Town; DrawnBy: Lawrence Stanton; Engineer: Lawrence Stanton; Organization: University of Cape Town; Address1: Department of Electrical Engineering; Address2: Rondebosch; Address3: Cape Town; Address4: South Africa 7701; DocumentNumber: 4; SheetNumber: 4; SheetTotal: 14
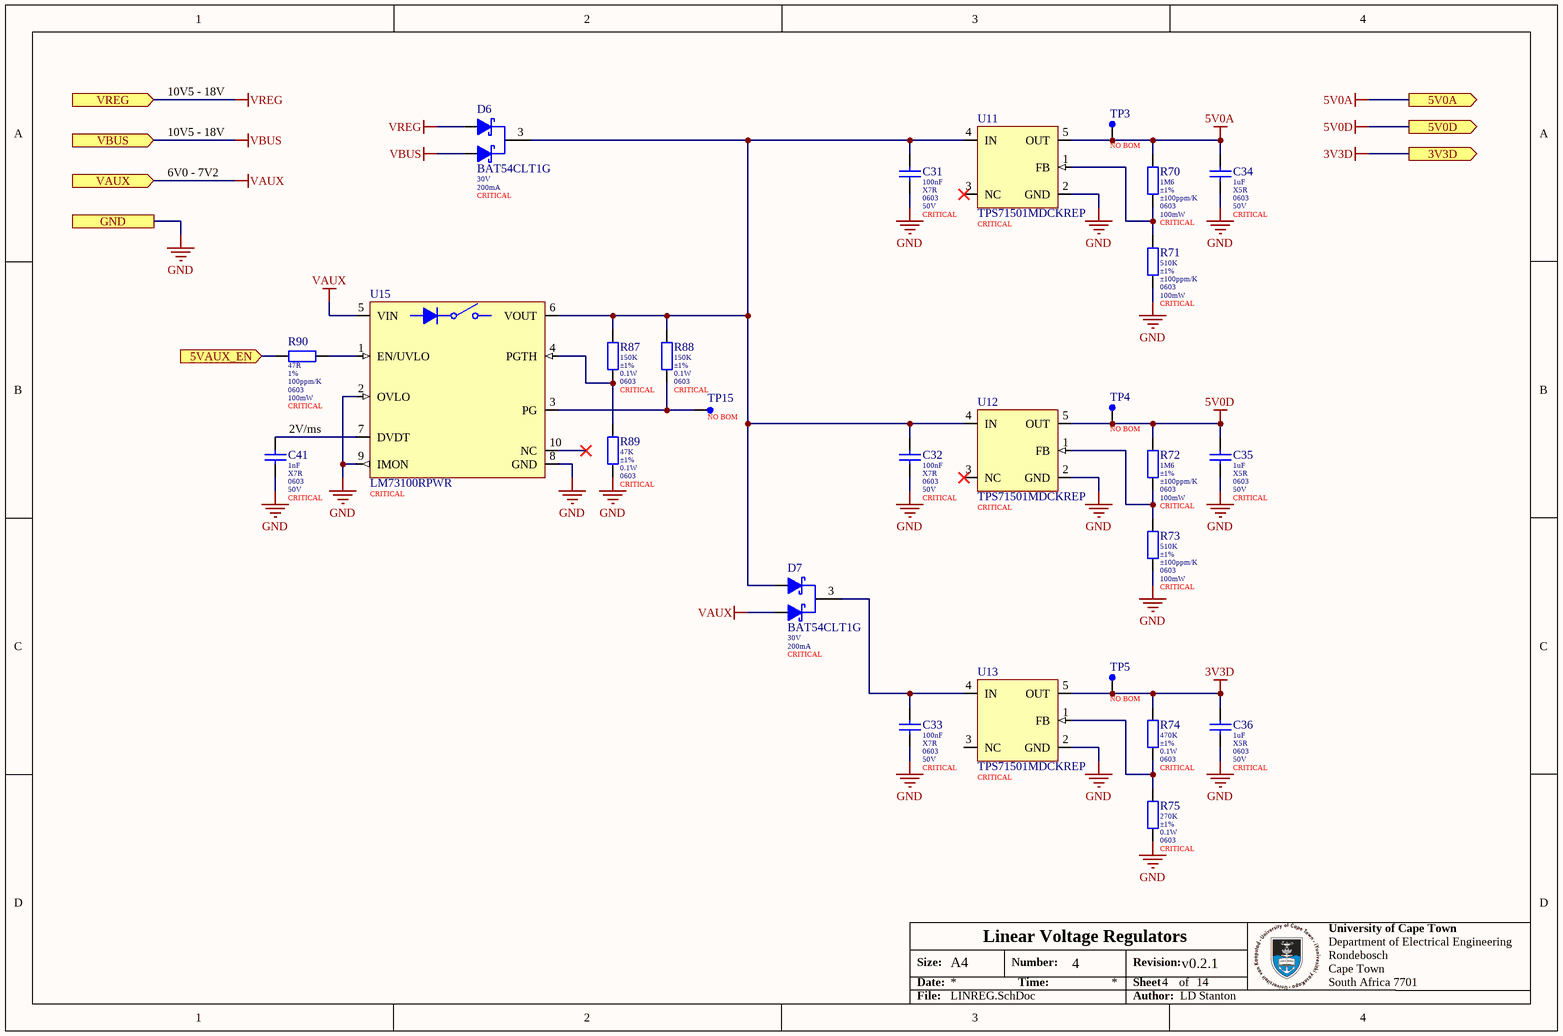
[diagram p12: LINREG.SchDoc]

### Parts
C31  value 100nF  Dielectric: X7R  Package: 0603  Voltage: 50V  Populate: CRITICAL  [0603 (Yageo DA) B]  (hidden comment: CC0603KRX7R9BB104)
C32  value 100nF  Dielectric: X7R  Package: 0603  Voltage: 50V  Populate: CRITICAL  [0603 (Yageo DA) B]  (hidden comment: CC0603KRX7R9BB104)
C33  value 100nF  Dielectric: X7R  Package: 0603  Voltage: 50V  Populate: CRITICAL  [0603 (Yageo DA) B]  (hidden comment: CC0603KRX7R9BB104)
C34  value 1uF  Dielectric: X5R  Package: 0603  Voltage: 50V  Populate: CRITICAL  [0603_080_8 (Samsung) B]  (hidden comment: CL10A105KB8NNNC)
C35  value 1uF  Dielectric: X5R  Package: 0603  Voltage: 50V  Populate: CRITICAL  [0603_080_8 (Samsung) B]  (hidden comment: CL10A105KB8NNNC)
C36  value 1uF  Dielectric: X5R  Package: 0603  Voltage: 50V  Populate: CRITICAL  [0603_080_8 (Samsung) B]  (hidden comment: CL10A105KB8NNNC)
C41  value 1nF  Dielectric: X7R  Package: 0603  Voltage: 50V  Populate: CRITICAL  [0603_080_8 (Samsung) B]  (hidden comment: CL10B102KB8NNNC)
D6  BAT54CLT1G  Reverse Voltage: 30V  Forward Current: 200mA  Placement: CRITICAL  [SOT-23 (BAT45CL) A]
D7  BAT54CLT1G  Reverse Voltage: 30V  Forward Current: 200mA  Placement: CRITICAL  [SOT-23 (BAT45CL) A]
R70  value 1M6  Tolerance: ±1%  Temperature Coefficient: ±100ppm/K  Package: 0603  Power: 100mW  Populate: CRITICAL  [0603 (Uniroyal) B]  (hidden comment: 0603WAF1604T5E)
R71  value 510K  Tolerance: ±1%  Temperature Coefficient: ±100ppm/K  Package: 0603  Power: 100mW  Populate: CRITICAL  [0603 (Uniroyal) B]  (hidden comment: 0603WAF5103T5E)
R72  value 1M6  Tolerance: ±1%  Temperature Coefficient: ±100ppm/K  Package: 0603  Power: 100mW  Populate: CRITICAL  [0603 (Uniroyal) B]  (hidden comment: 0603WAF1604T5E)
R73  value 510K  Tolerance: ±1%  Temperature Coefficient: ±100ppm/K  Package: 0603  Power: 100mW  Populate: CRITICAL  [0603 (Uniroyal) B]  (hidden comment: 0603WAF5103T5E)
R74  value 470K  Tolerance: ±1%  Power: 0.1W  Package: 0603  Populate: CRITICAL  [0603 (Uniroyal) B]  (hidden comment: 0603WAF4703T5E)
R75  value 270K  Tolerance: ±1%  Power: 0.1W  Package: 0603  Populate: CRITICAL  [0603 (Uniroyal) B]  (hidden comment: 0603WAF2703T5E)
R87  value 150K  Tolerance: ±1%  Power: 0.1W  Package: 0603  Populate: CRITICAL  [0603 (Uniroyal) B]  (hidden comment: 0603WAF1503T5E)
R88  value 150K  Tolerance: ±1%  Power: 0.1W  Package: 0603  Populate: CRITICAL  [0603 (Uniroyal) B]  (hidden comment: 0603WAF1503T5E)
R89  value 47K  Tolerance: ±1%  Power: 0.1W  Package: 0603  Populate: CRITICAL  [0603 (Uniroyal) B]  (hidden comment: 0603WAF4702T5E)
R90  value 47R  Tolerance: 1%  Temperature Coefficient: 100ppm/K  Package: 0603  Power: 100mW  Populate: CRITICAL  [0603 (Uniroyal) B]  (hidden comment: 0603WAF470JT5E)
TP3  Placement: NO BOM  [Test Point Pad 1.0mm]  (hidden comment: Test Point)  (no BOM)
TP4  Placement: NO BOM  [Test Point Pad 1.0mm]  (hidden comment: Test Point)  (no BOM)
TP5  Placement: NO BOM  [Test Point Pad 1.0mm]  (hidden comment: Test Point)  (no BOM)
TP15  Placement: NO BOM  [Test Point Pad 0.6mm]  (hidden comment: Test Point)  (no BOM)
U11  TPS71501MDCKREP  Placement: CRITICAL  [SOT-5 (DCK0005A) A]
U12  TPS71501MDCKREP  Placement: CRITICAL  [SOT-5 (DCK0005A) A]
U13  TPS71501MDCKREP  Placement: CRITICAL  [SOT-5 (DCK0005A) A]
U15  LM73100RPWR  Placement: CRITICAL  [VQFN-10 (LM73100) MFG]

### Ports
3V3D (out), 5V0A (out), 5V0D (out), 5VAUX_EN (in), GND, VAUX (in), VBUS (in), VREG (in)

### Nets
3V3D: C36.1 R74.1 TP5.1 U13.5(OUT) ; port 3V3D  [project net 3V3]
5V0A: C34.1 R70.1 TP3.1 U11.5(OUT) ; port 5V0A
5V0D: C35.1 R72.1 TP4.1 U12.5(OUT) ; port 5V0D
GND: C31.2 C32.2 C33.2 C34.2 C35.2 C36.2 C41.2 R71.2 R73.2 R75.2 R89.2 U11.2(GND) U12.2(GND) U13.2(GND) U15.2(OVLO) U15.8(GND) U15.9(IMON) ; port GND
VAUX: D7.1(A1) U15.5(VIN) ; port VAUX
VBUS: D6.1(A1) ; port VBUS
VREG: D6.2(A2) ; port VREG
AUX_5VEN: R90.1 ; port 5VAUX_EN
NetC31_1: C31.1 C32.1 D6.3(K) D7.2(A2) R87.1 R88.1 U11.4(IN) U12.4(IN) U15.6(VOUT)
NetC33_1: C33.1 D7.3(K) U13.4(IN)
NetC41_1: C41.1 U15.7(DVDT)
NetR70_2: R70.2 R71.1 U11.1(FB)
NetR72_2: R72.2 R73.1 U12.1(FB)
NetR74_2: R74.2 R75.1 U13.1(FB)
NetR87_2: R87.2 R89.1 U15.4(PGTH)
NetR88_2: R88.2 TP15.1 U15.3(PG)
NetR90_2: R90.2 U15.1(EN/UVLO)

Not connected (* = marked no-connect by the designer): U11 3(NC)*; U12 3(NC)*; U13 3(NC); U15 10(NC)*

### Notes on the sheet
- 10V5 - 18V
- 6V0 - 7V2
- (near C41) 2V/ms
- Size:
- Date:
- A4
- Number:
- Time:
- Revision:
- Sheet
- of
- File:
- Author:

### Library data of the parts
C31-C33 = CMP-047-000000-9: MLCC 100nF 50V 0603 X7R ±10%; Manufacturer: Yageo; Tolerance: ±10%; ComponentLink1Description: Datasheet; ComponentLink1URL: https://datasheet.lcsc.com/szlcsc/YAGEO-CC0603KRX7R9BB104_C14663.pdf; LCSC Part Number: C14663
C34-C36 = CMP-045-000002-11: MLCC 1uF 0603 50V X5R ±10%; Manufacturer: Samsung; ComponentLink1URL: https://datasheet.lcsc.com/szlcsc/Samsung-Electro-Mechanics-CL05C100JB5NNNC_C32949.pdf; ComponentLink1Description: Datasheet; Tolerance: ±10%; LCSC Part Number: C15849
C41 = CMP-045-000000-10: MLCC 1nF 0603 50V X7R ±10%; Manufacturer: Samsung; ComponentLink1URL: https://datasheet.lcsc.com/szlcsc/Samsung-Electro-Mechanics-CL05C100JB5NNNC_C32949.pdf; Tolerance: ±10%; ComponentLink1Description: Datasheet; LCSC Part Number: C1588
D6 D7 = CMP-022-000003-4: Schottky Barrier Diode Common Cathode 30V 200mA ON Semi; ComponentLink1Description: Datasheet; LCSC Part Number: C14308; ComponentLink1URL: https://datasheet.lcsc.com/szlcsc/ON-Semicon-ON-SBAT54CLT1G_C124141.pdf
R70 R72 = CMP-00138-2: Resistor 1M6 0603 ±1% Thick Film Uniroyal; Voltage Rating: 75V; Manufacturer: Uniroyal; ComponentLink1Description: Datasheet; ComponentLink1URL: https://datasheet.lcsc.com/szlcsc/1811062009_UNI-ROYAL-Uniroyal-Elec-0603WAF1002T5E_C25804.pdf; Composition: Thick Film; LCSC Part Number: C22770; Max Operating Temperature: 155°C; Min Operating Temperature: -55°C
R71 R73 = CMP-00137-1: Resistor 510K 0603 ±1% Thick Film Uniroyal; Voltage Rating: 75V; Min Operating Temperature: -55°C; ComponentLink1Description: Datasheet; Manufacturer: Uniroyal; LCSC Part Number: C23192; ComponentLink1URL: https://datasheet.lcsc.com/szlcsc/1811062009_UNI-ROYAL-Uniroyal-Elec-0603WAF1002T5E_C25804.pdf; Max Operating Temperature: 155°C; Composition: Thick Film
R74 = CMP-010-000402-2: Resistor 470K 0603 ±1% Thick Film Uniroyal; Temperature Coefficient: ±100ppm/K; Working Voltage: 75V; LCSC Part Number: C23178; Pin Count: 2; Temperature: -55 - 155°C; ComponentLink1Description: Datasheet; Manufacturer: Uniroyal; ComponentLink1URL: https://datasheet.lcsc.com/szlcsc/1811062009_UNI-ROYAL-Uniroyal-Elec-0603WAF1002T5E_C25804.pdf
R75 = CMP-010-000411-2: Resistor 270K 0603 ±1% Thick Film Uniroyal; Temperature Coefficient: ±100ppm/K; Working Voltage: 75V; Pin Count: 2; ComponentLink1Description: Datasheet; Manufacturer: Uniroyal; LCSC Part Number: C22965; ComponentLink1URL: https://datasheet.lcsc.com/szlcsc/1811062009_UNI-ROYAL-Uniroyal-Elec-0603WAF1002T5E_C25804.pdf; Temperature: -55 - 155°C
R87 R88 = CMP-010-000303-9: Resistor 150K 0603 ±1% Thick Film Uniroyal; Temperature Coefficient: ±100ppm/K; Working Voltage: 75V; Manufacturer: Uniroyal; ComponentLink1URL: https://datasheet.lcsc.com/szlcsc/1811062009_UNI-ROYAL-Uniroyal-Elec-0603WAF1002T5E_C25804.pdf; Temperature: -55 - 155°C; LCSC Part Number: C22807; ComponentLink1Description: Datasheet; Pin Count: 2
R89 = CMP-010-000404-2: Resistor 47K 0603 ±1% Thick Film Uniroyal; Temperature Coefficient: ±100ppm/K; Working Voltage: 75V; ComponentLink1Description: Datasheet; LCSC Part Number: C25819; Temperature: -55 - 155°C; Manufacturer: Uniroyal; Pin Count: 2; ComponentLink1URL: https://datasheet.lcsc.com/szlcsc/1811062009_UNI-ROYAL-Uniroyal-Elec-0603WAF1002T5E_C25804.pdf
R90 = CMP-00128-3: Resistor 47R 0603 ±1% Thick Film Uniroyal; Voltage Rating: 75V; ComponentLink1Description: Datasheet; Min Operating Temperature: -55°C; Manufacturer: Uniroyal; ComponentLink1URL: https://datasheet.lcsc.com/szlcsc/1811062009_UNI-ROYAL-Uniroyal-Elec-0603WAF1002T5E_C25804.pdf; Composition: Thick Film; LCSC Part Number: C23182; Max Operating Temperature: 155°C
TP3-TP5 TP15 = CMP-00028-00001-10: Test Point Pad
U11-U13 = CMP-00134-2: Enhanced Product 50 mA, 24 V, 3.2 uA Supply Current, Low Dropout, Linear Regulator; Max Output Current: 50mA; Max Input Voltage: 24V; Dropout Voltage: 415mV; Min Operating Temperature: -55°C; ComponentLink1URL: https://www.ti.com/cn/lit/ds/symlink/tps71501-ep.pdf?ts=1757343311963; LCSC Part Number: C2865892; ComponentLink1Description: Datasheet; Max Operating Temperature: 125°C
U15 = CMP-00143-2: 2.7V~23V 5.5A VQFN-10-HR(2x2) Power Distribution Switches ROHS; Max Supply Voltage: 23V; Min Supply Voltage: 2.7V; LCSC Part Number: C3210761; Min Operating Temperature: -40°C; Max Operating Temperature: 125°C

## Sheet BATT.SchDoc: Battery Terminal Connection
size A4; ApprovedBy: LD Stanton; Author: LD Stanton; CompanyName: University of Cape Town; DrawnBy: Lawrence Stanton; Engineer: Lawrence Stanton; Organization: University of Cape Town; Address1: Department of Electrical Engineering; Address2: Rondebosch; Address3: Cape Town; Address4: South Africa 7701; DocumentNumber: 2; SheetNumber: 2; SheetTotal: 14
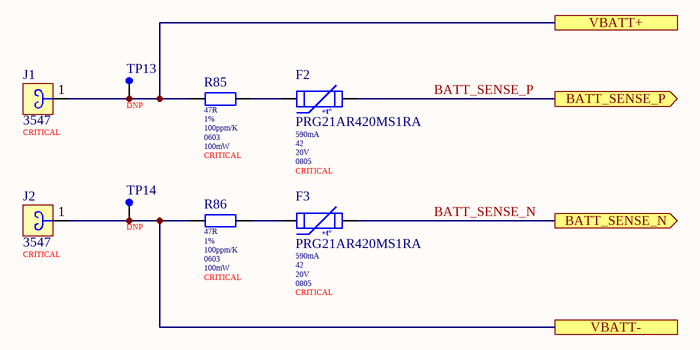
[diagram p13: BATT.SchDoc]

### Parts
F2  PRG21AR420MS1RA  Current: 590mA  Resistance: 42  Voltage: 20V  Package: 0805  Placement: CRITICAL  [0805 Fuse (PRG21AR420MS1RA) MRG B]
F3  PRG21AR420MS1RA  Current: 590mA  Resistance: 42  Voltage: 20V  Package: 0805  Placement: CRITICAL  [0805 Fuse (PRG21AR420MS1RA) MRG B]
J1  3547  Placement: CRITICAL  [3547]
J2  3547  Placement: CRITICAL  [3547]
R85  value 47R  Tolerance: 1%  Temperature Coefficient: 100ppm/K  Package: 0603  Power: 100mW  Populate: CRITICAL  [0603 (Uniroyal) B]  (hidden comment: 0603WAF470JT5E)
R86  value 47R  Tolerance: 1%  Temperature Coefficient: 100ppm/K  Package: 0603  Power: 100mW  Populate: CRITICAL  [0603 (Uniroyal) B]  (hidden comment: 0603WAF470JT5E)
TP13  Placement: DNP  [Test Point Keystone 5000]  (hidden comment: 5000)
TP14  Placement: DNP  [Test Point Keystone 5001]  (hidden comment: 5001)

### Ports
BATT_SENSE_N (out), BATT_SENSE_P (out), VBATT+, VBATT-

### Nets
GND: J2.1 R86.1 TP14.1 ; port VBATT-
VBATT: J1.1 R85.1 TP13.1 ; port VBATT+
BATT_SENSE_N: F3.2 ; port BATT_SENSE_N
BATT_SENSE_P: F2.2 ; port BATT_SENSE_P
NetF2_1: F2.1 R85.2
NetF3_1: F3.1 R86.2

### Notes on the sheet
- Size:
- Date:
- A4
- Number:
- Time:
- Revision:
- Sheet
- of
- File:
- Author:
- (in symbol CMP-00144-1) +t°

### Library data of the parts
F2 F3 = CMP-00144-1: Thermistor PTC 42 Ohm 20% 2-Pin 0805 Surface Mount Solder Pad T/R Automotive; ComponentLink1URL: https://jlcpcb.com/api/file/downloadByFileSystemAccessId/8588911221270073344; Max Operating Temperature: 105°C; Min Operating Temperature: -40°C; ComponentLink1Description: Datasheet; LCSC Part Number: C341812
J1 J2 = CMP-00119-1: Female PCB Terminal 6.4x0.81mm Tabs; pin to pad: 1>1A+1B; ComponentLink2Description: Drawing; ComponentLink1Description: Product Page; ComponentLink2URL: https://www.keyelco.com/product-pdf.cfm?p=681; ComponentLink3Description: Catalogue; LCSC Part Number: C3029552; ComponentLink3URL: https://www.keyelco.com/userAssets/file/M65p61.pdf; ComponentLink1URL: https://www.keyelco.com/product.cfm/Horizontal-Entry/3547/product_id/681
R85 R86 = CMP-00128-3: as R90 on sheet LINREG; ComponentLink1Description: Datasheet; Min Operating Temperature: -55°C; Manufacturer: Uniroyal; ComponentLink1URL: https://datasheet.lcsc.com/szlcsc/1811062009_UNI-ROYAL-Uniroyal-Elec-0603WAF1002T5E_C25804.pdf; Composition: Thick Film; LCSC Part Number: C23182; Max Operating Temperature: 155°C
TP13 = CMP-00140-2: Keystone Test Point Insulated Ring Red; LCSC Part Number: C5199900
TP14 = CMP-00028-00009-2: Keystone Test Point Insulated Ring Black; LCSC Part Number: C238122

## Nets that join several sheets
3V3: MCU (7 pins), SWD (7 pins), ADC (5 pins), LINREG (C36.1 R74.1 TP5.1 U13.5)
5V0A: RMS (8 pins), EL (8 pins), VBATT Sense (C13.1 R33.1 U7.8), ADC (C11.1 U6.26), LINREG (C34.1 R70.1 TP3.1 U11.5)
5V0D: Temp Sense (5 pins), RS485 (C40.1 U14.8), IDC Conn (C26.2 C27.2 D1.5 D2.5), LINREG (C35.1 R72.1 TP4.1 U12.5)
GND: Main (H1.1), Temp Sense (8 pins), MCU (8 pins), SWD (9 pins), RS485 (C40.2 U14.5), IDC Conn (10 pins), RMS (8 pins), EL (15 pins), VBATT Sense (C13.2 R31.3 R35.2 U7.4), ADC (17 pins), ADC AIN (9 pins), LINREG (17 pins), BATT (J2.1 R86.1 TP14.1)
VAUX: IDC Conn (J3.1 J3.17), LINREG (D7.1 U15.5)
VBATT: Temp Sense (RT1.2), RMS (C5.1), EL (Q1.3), VBATT Sense (R30.3), BATT (J1.1 R85.1 TP13.1)
VBUS: IDC Conn (6 pins), LINREG (D6.1)
~{RST}: MCU (U3.10), IDC Conn (D1.3)
ADC_AIN0: ADC (U6.7), ADC AIN (C18.2 C19.2 R34.2)
ADC_AIN1: ADC (U6.6), ADC AIN (C17.1 C18.1 R32.2)
ADC_AIN2: ADC (U6.5), ADC AIN (C24.2 C25.2 R66.2)
ADC_AIN3: ADC (U6.4), ADC AIN (C23.1 C24.1 R63.2)
ADC_AIN4: ADC (U6.3), ADC AIN (C15.2 C16.2 R25.2)
ADC_AIN5: ADC (U6.2), ADC AIN (C14.1 C15.1 R24.2)
ADC_~{DRDY}: MCU (U3.24), ADC (R23.1)
ADC_~{RST}: MCU (U3.21), ADC (R22.1)
ADC_START: MCU (U3.22), ADC (R21.1)
ADC_VREF: MCU (R12.1), ADC (C12.1 U6.23)
AUX_5VEN: MCU (U3.1), LINREG (R90.1)
BATT_SENSE_N: IDC Conn (J3.15), BATT (F3.2)
BATT_SENSE_P: IDC Conn (J3.13), BATT (F2.2)
EIS_EN: MCU (U3.12), RMS (R67.1), EL (R60.1 R96.2)
EIS_VBATT_N: VBATT Sense (R31.4 U7.6 U7.7), ADC AIN (R63.1 TP8.1)
EIS_VBATT_P: VBATT Sense (R30.4 U7.1), ADC AIN (R66.1 TP9.1)
EIS_VISENSE_N: EL (R44.3 R46.1 U8.6), ADC AIN (R32.1 TP7.1)
EIS_VISENSE_P: EL (5 pins), ADC AIN (R34.1 TP6.1)
EIS_VRMS_N: RMS (6 pins), ADC AIN (R24.1 TP1.1)
EIS_VRMS_P: RMS (C9.2 R7.2 R11.2 U4.1), ADC AIN (R25.1 TP2.1)
EN: MCU (U3.38), IDC Conn (D1.1)
I2C_INT_ALERT: Temp Sense (U1.3 U2.3), MCU (R84.2 U3.44)
MCU_DAC: MCU (R69.1), EL (R55.1)
OK: MCU (U3.39), IDC Conn (R91.1)

## Assembly variants
JLCPCB PCBA: not fitted J3 R?; alternate parts U14 -> CMP-00142-2, U11 -> CMP-00146-1, U12 -> CMP-00146-1, U13 -> CMP-00146-1